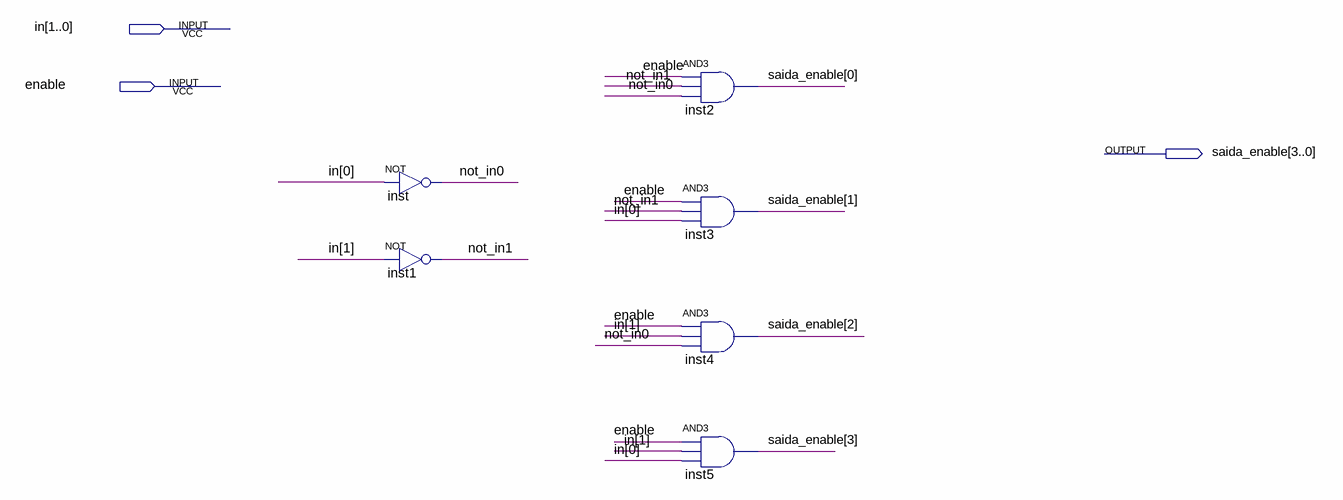
[diagram p0: schematic sheet]
// Quartus schematic decodificador2x4.bdf as structural Verilog: 6 symbols, 3 pins
module decodificador2x4 (
  input  [1:0] in,
  input  enable,
  output [3:0] saida_enable
);

  wire not_in0, not_in1;

  not inst (not_in0, in[0]);
  not inst1 (not_in1, in[1]);
  and inst2 (saida_enable[0], enable, not_in1, not_in0);
  and inst3 (saida_enable[1], enable, not_in1, in[0]);
  and inst4 (saida_enable[2], enable, in[1], not_in0);
  and inst5 (saida_enable[3], enable, in[1], in[0]);
endmodule
